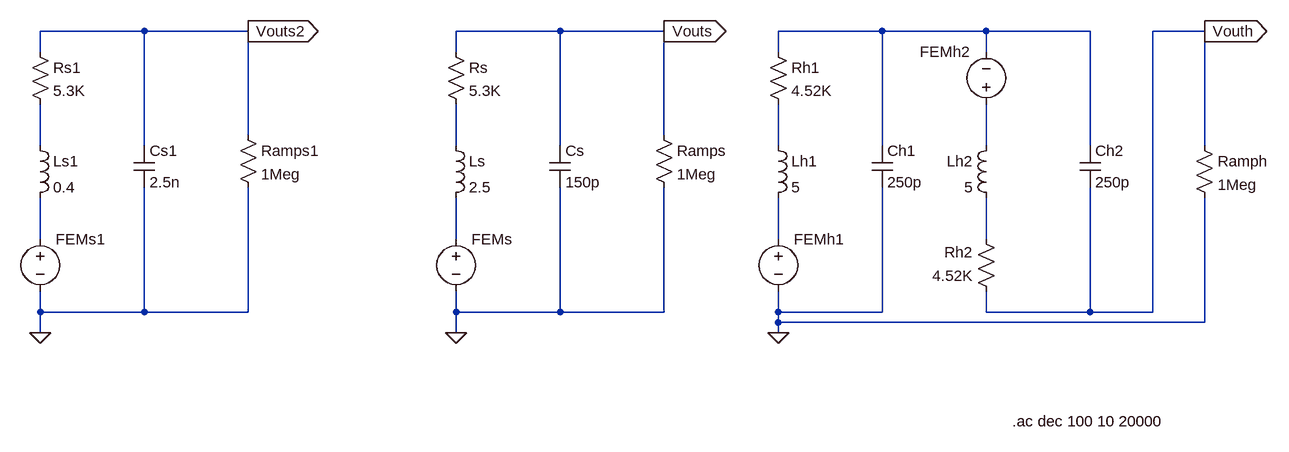
[diagram p0: schematic Model elec.asc]
Model elec.asc, the LTspice schematic file:
Version 4.1
SHEET 1 2016 1016
WIRE 256 400 96 400
WIRE 416 400 256 400
WIRE 896 400 736 400
WIRE 1056 400 896 400
WIRE 1392 400 1232 400
WIRE 1552 400 1392 400
WIRE 1712 400 1552 400
WIRE 1888 400 1808 400
WIRE 96 432 96 400
WIRE 736 432 736 400
WIRE 1232 432 1232 400
WIRE 1552 432 1552 400
WIRE 416 560 416 400
WIRE 1056 560 1056 400
WIRE 96 576 96 512
WIRE 256 576 256 400
WIRE 736 576 736 512
WIRE 896 576 896 400
WIRE 1232 576 1232 512
WIRE 1392 576 1392 400
WIRE 1552 576 1552 512
WIRE 1712 576 1712 400
WIRE 1888 576 1888 400
WIRE 96 720 96 656
WIRE 736 720 736 656
WIRE 1232 720 1232 656
WIRE 1552 720 1552 656
WIRE 96 832 96 800
WIRE 256 832 256 640
WIRE 256 832 96 832
WIRE 416 832 416 640
WIRE 416 832 256 832
WIRE 736 832 736 800
WIRE 896 832 896 640
WIRE 896 832 736 832
WIRE 1056 832 1056 640
WIRE 1056 832 896 832
WIRE 1232 832 1232 800
WIRE 1392 832 1392 640
WIRE 1392 832 1232 832
WIRE 1552 832 1552 800
WIRE 1712 832 1712 640
WIRE 1712 832 1552 832
WIRE 1808 832 1808 400
WIRE 1808 832 1712 832
WIRE 1232 848 1232 832
WIRE 1888 848 1888 656
WIRE 1888 848 1232 848
WIRE 96 864 96 832
WIRE 736 864 736 832
WIRE 1232 864 1232 848
FLAG 736 864 0
FLAG 1232 864 0
FLAG 1056 400 Vouts
IOPIN 1056 400 Out
FLAG 1888 400 Vouth
IOPIN 1888 400 Out
FLAG 96 864 0
FLAG 416 400 Vouts2
IOPIN 416 400 Out
SYMBOL voltage 736 704 R0
WINDOW 39 0 0 Left 0
SYMATTR InstName FEMs
SYMATTR Value ""
SYMATTR Value2 AC 1
SYMBOL ind 720 560 R0
SYMATTR InstName Ls
SYMATTR Value 2.5
SYMBOL res 720 416 R0
SYMATTR InstName Rs
SYMATTR Value 5.3K
SYMBOL cap 880 576 R0
SYMATTR InstName Cs
SYMATTR Value 150p
SYMBOL res 1040 544 R0
SYMATTR InstName Ramps
SYMATTR Value 1Meg
SYMBOL voltage 1232 704 R0
WINDOW 39 0 0 Left 0
SYMATTR InstName FEMh1
SYMATTR Value ""
SYMATTR Value2 AC 1
SYMBOL ind 1216 560 R0
SYMATTR InstName Lh1
SYMATTR Value 5
SYMBOL res 1216 416 R0
SYMATTR InstName Rh1
SYMATTR Value 4.52K
SYMBOL cap 1376 576 R0
SYMATTR InstName Ch1
SYMATTR Value 250p
SYMBOL voltage 1552 528 R180
WINDOW 0 24 96 Left 2
WINDOW 3 24 16 Left 2
WINDOW 39 0 0 Left 0
SYMATTR InstName FEMh2
SYMATTR Value ""
SYMATTR Value2 AC 1
SYMBOL ind 1568 560 M0
SYMATTR InstName Lh2
SYMATTR Value 5
SYMBOL res 1568 816 R180
WINDOW 0 36 76 Left 2
WINDOW 3 36 40 Left 2
SYMATTR InstName Rh2
SYMATTR Value 4.52K
SYMBOL cap 1696 576 R0
SYMATTR InstName Ch2
SYMATTR Value 250p
SYMBOL res 1872 560 R0
SYMATTR InstName Ramph
SYMATTR Value 1Meg
SYMBOL voltage 96 704 R0
WINDOW 39 0 0 Left 0
SYMATTR InstName FEMs1
SYMATTR Value ""
SYMATTR Value2 AC 1
SYMBOL ind 80 560 R0
SYMATTR InstName Ls1
SYMATTR Value 0.4
SYMBOL res 80 416 R0
SYMATTR InstName Rs1
SYMATTR Value 5.3K
SYMBOL cap 240 576 R0
SYMATTR InstName Cs1
SYMATTR Value 2.5n
SYMBOL res 400 544 R0
SYMATTR InstName Ramps1
SYMATTR Value 1Meg
TEXT 1592 1000 Left 2 !.ac dec 100 10 20000

The netlist it stands for:
* Model elec.asc
V§FEMs N007 0 AC 1
Ls N003 N007 2.5
Rs Vouts N003 5.3K
Cs Vouts 0 150p
Ramps Vouts 0 1Meg
V§FEMh1 N008 0 AC 1
Lh1 N004 N008 5
Rh1 N001 N004 4.52K
Ch1 N001 0 250p
V§FEMh2 N005 N001 AC 1
Lh2 N005 N009 5
Rh2 Vouth N009 4.52K
Ch2 N001 Vouth 250p
Ramph Vouth 0 1Meg
V§FEMs1 N006 0 AC 1
Ls1 N002 N006 0.4
Rs1 Vouts2 N002 5.3K
Cs1 Vouts2 0 2.5n
Ramps1 Vouts2 0 1Meg
.ac dec 100 10 20000
.backanno
.end

* Results of the author's LTspice run, read from the files saved beside the schematic
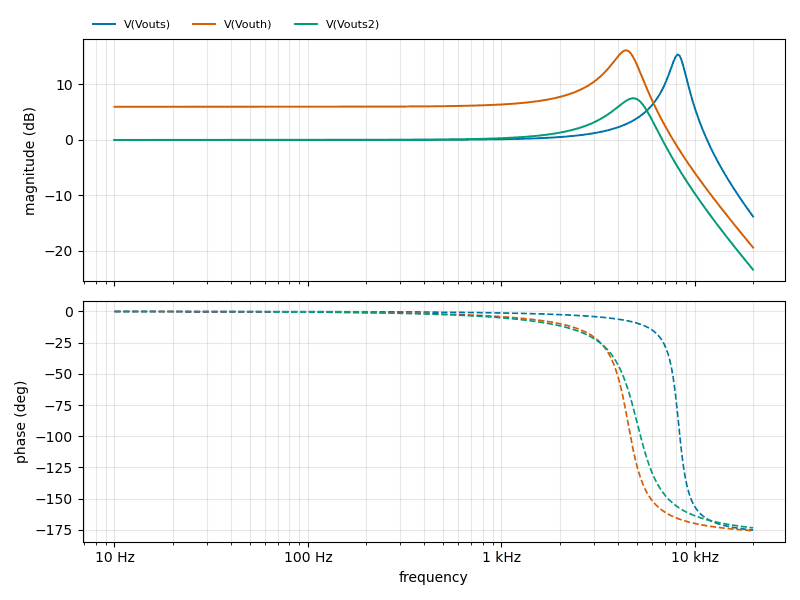
[diagram p1: AC Analysis of Model elec.asc, plotted from the saved traces]
* AC Analysis, 1 run:
*   V(Vouts): -0.05 dB at 10 Hz, -13.86 dB at 20 kHz, peak 15.37 dB at 8.128 kHz, 3 dB below the peak at 7.441 kHz and 8.857 kHz
*   V(Vouth): 5.94 dB at 10 Hz, -19.45 dB at 20 kHz, peak 16.11 dB at 4.365 kHz, 3 dB below the peak at 3.618 kHz and 5.078 kHz
*   V(Vouts2): -0.05 dB at 10 Hz, -23.46 dB at 20 kHz, peak 7.48 dB at 4.786 kHz, 3 dB below the peak at 3.52 kHz and 5.814 kHz